# Altium schematic sheet MCU.SchDoc
size A4; SheetNumber: 2; SheetTotal: 5
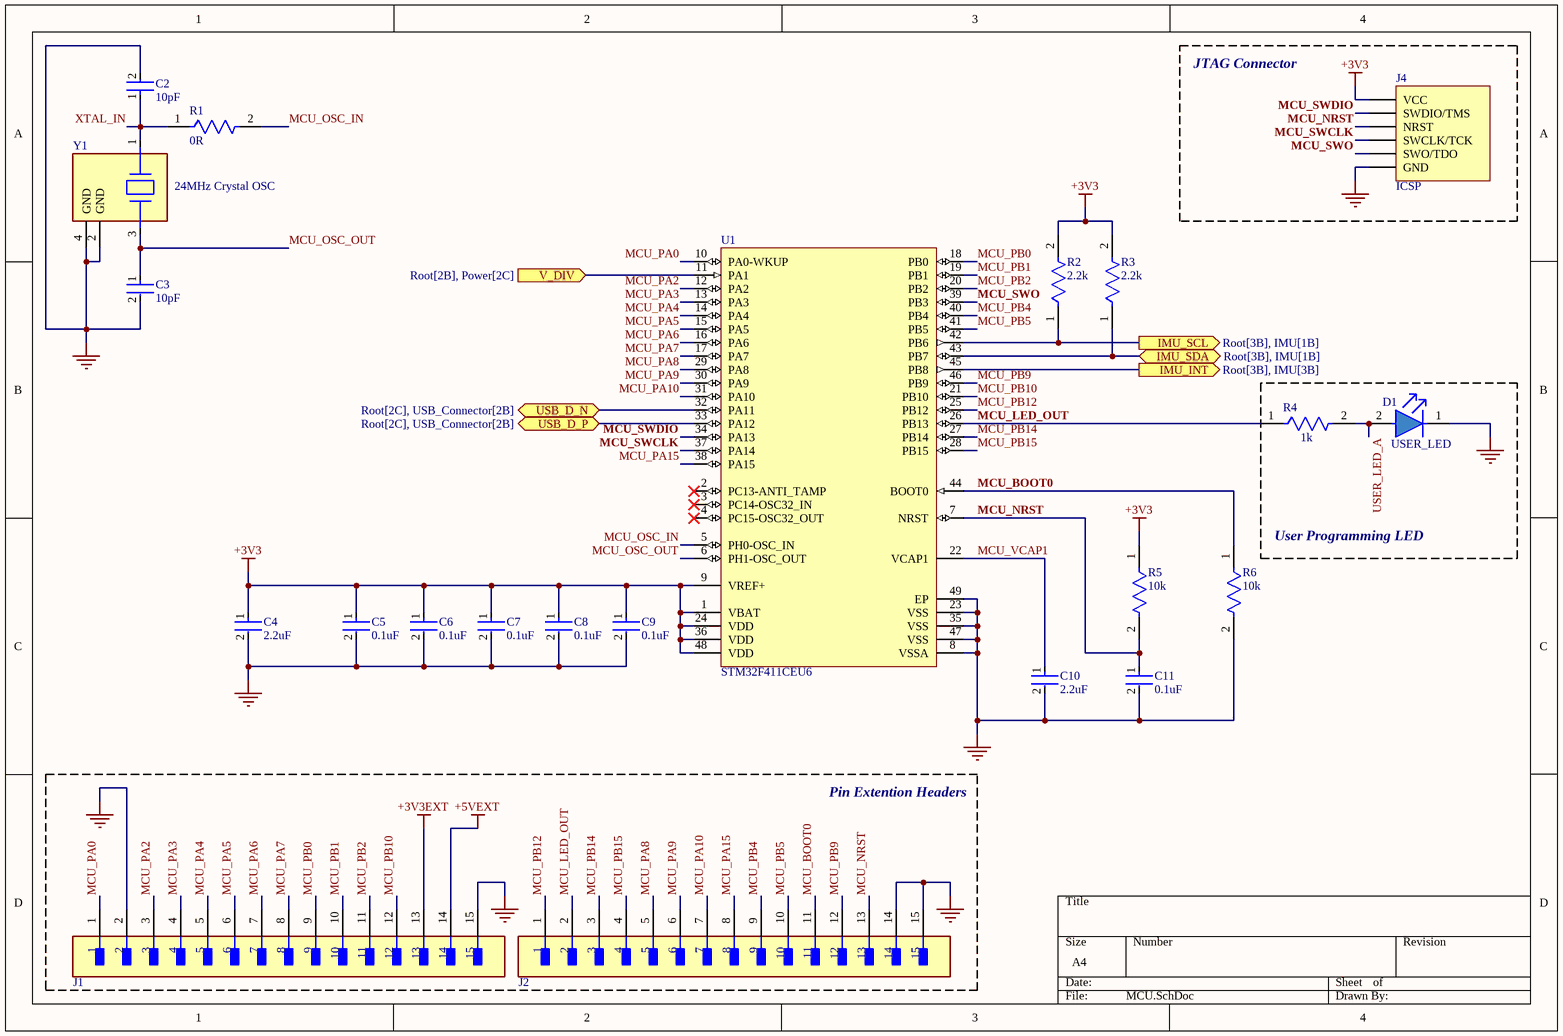
[diagram p0: MCU.SchDoc]

## Parts
C2  10pF  [FP-C0402-BB-MFG]
C3  10pF  [FP-C0402-BB-MFG]
C4  2.2uF  [FP-CC0603-DA-MFG]
C5  0.1uF  [FP-CC0402-MFG]
C6  0.1uF  [FP-CC0402-MFG]
C7  0.1uF  [FP-CC0402-MFG]
C8  0.1uF  [FP-CC0402-MFG]
C9  0.1uF  [FP-CC0402-MFG]
C10  2.2uF  [FP-CC0603-DA-MFG]
C11  0.1uF  [FP-CC0402-MFG]
D1  USER_LED  [FP-LTST-C191TBKT-MFG]
J1  TSW-115-23-T-S  [FP-TSW-115-23-T-S-MFG]  (value not drawn)
J2  TSW-115-23-T-S  [FP-TSW-115-23-T-S-MFG]  (value not drawn)
J4  ICSP  [TC2030-MCP-NL]  (no BOM)
R1  0R  [FP-MCS0402-MFG]
R2  2.2k  [FP-RT0402-MFG]
R3  2.2k  [FP-RT0402-MFG]
R4  1k  [FP-AT0402-MFG]
R5  10k  [FP-RT0402-MFG]
R6  10k  [FP-RT0402-MFG]
U1  STM32F411CEU6  [STM-UFQFPN48_L]
Y1  24MHz Crystal OSC  [FP-ABM10W-MFG]

## Blocks framed on the sheet
JTAG Connector: J4
User Programming LED: D1 R4

## Ports
IMU_INT (out, see Root[3B], IMU[3B]), IMU_SCL (out, see Root[3B], IMU[1B]), IMU_SDA (bidir, see Root[3B], IMU[1B]), USB_D_N (bidir, see Root[2C], USB_Connector[2B]), USB_D_P (bidir, see Root[2C], USB_Connector[2B]), V_DIV (in, see Root[2B], Power[2C])

## Nets
+3V3: C4.1 C5.1 C6.1 C7.1 C8.1 C9.1 J4.1(VCC) R2.2 R3.2 R5.1 U1.1(VBAT) U1.9(VREF+) U1.24(VDD) U1.36(VDD) U1.48(VDD)
+3V3EXT: J1.13
+5VEXT: J1.14
GND: C2.2 C3.2 C4.2 C5.2 C6.2 C7.2 C8.2 C9.2 C10.2 C11.2 D1.1(C) J1.2 J1.15 J2.14 J2.15 J4.5(GND) R6.2 U1.8(VSSA) U1.23(VSS) U1.35(VSS) U1.47(VSS) U1.49(EP) Y1.2(GND) Y1.4(GND)
IMU_INT: U1.45(PB8) ; port IMU_INT
IMU_SCL: R2.1 U1.42(PB6) ; port IMU_SCL
IMU_SDA: R3.1 U1.43(PB7) ; port IMU_SDA
MCU_BOOT0: J2.11 R6.1 U1.44(BOOT0)
MCU_LED_OUT: J2.2 R4.1 U1.26(PB13)
MCU_NRST: C11.1 J2.13 J4.3(NRST) R5.2 U1.7(NRST)
MCU_OSC_IN: R1.2 U1.5(PH0-OSC_IN)
MCU_OSC_OUT: C3.1 U1.6(PH1-OSC_OUT) Y1.3
MCU_PA0: J1.1 U1.10(PA0-WKUP)
MCU_PA2: J1.3 U1.12(PA2)
MCU_PA3: J1.4 U1.13(PA3)
MCU_PA4: J1.5 U1.14(PA4)
MCU_PA5: J1.6 U1.15(PA5)
MCU_PA6: J1.7 U1.16(PA6)
MCU_PA7: J1.8 U1.17(PA7)
MCU_PA8: J2.5 U1.29(PA8)
MCU_PA9: J2.6 U1.30(PA9)
MCU_PA10: J2.7 U1.31(PA10)
MCU_PA15: J2.8 U1.38(PA15)
MCU_PB0: J1.9 U1.18(PB0)
MCU_PB1: J1.10 U1.19(PB1)
MCU_PB2: J1.11 U1.20(PB2)
MCU_PB4: J2.9 U1.40(PB4)
MCU_PB5: J2.10 U1.41(PB5)
MCU_PB9: J2.12 U1.46(PB9)
MCU_PB10: J1.12 U1.21(PB10)
MCU_PB12: J2.1 U1.25(PB12)
MCU_PB14: J2.3 U1.27(PB14)
MCU_PB15: J2.4 U1.28(PB15)
MCU_SWCLK: J4.4(SWCLK/TCK) U1.37(PA14)
MCU_SWDIO: J4.2(SWDIO/TMS) U1.34(PA13)
MCU_SWO: J4.6(SWO/TDO) U1.39(PB3)
MCU_VCAP1: C10.1 U1.22(VCAP1)
USB_D_N: U1.32(PA11) ; port USB_D_N
USB_D_P: U1.33(PA12) ; port USB_D_P
USER_LED_A: D1.2(A) R4.2
V_DIV: U1.11(PA1) ; port V_DIV
XTAL_IN: C2.1 R1.1 Y1.1

Not connected (* = marked no-connect by the designer): U1 2(PC13-ANTI_TAMP)* 3(PC14-OSC32_IN)* 4(PC15-OSC32_OUT)*

## Notes on the sheet
- Pin Extention Headers

## Library data of the parts
C2 C3 = CMP-03020-018108-1: C0402 10 pF X7R 10.00% 16 V; Manufacturer: Kemet; Manufacturer Part Number: C0402C100K4RACAUTO; Tolerance: 0.1; Material: Ceramic; Temperature Coefficient: 15%; Voltage Rating: 16 V; Temperature: -55°C to +125°C; Ipc Land Pattern Name: CAPC10050X50; Temperature Characteristic: X7R; Automotive: No; ComponentLink2Description: Datasheet; Device Class L2: Capacitors; Temperature Range High: +125°C; ComponentLink2URL: https://content.kemet.com/datasheets/KEM_C1002_X7R_SMD.pdf; Device Class L1: Passive Components; Category: Cap; Value: 10 pF; Device Class L3: Ceramic Capacitors; Lead Free: Yes; Octopart: https://octopart.com/c0402c100k4racauto-kemet-91893731; RoHS: TRUE; Package: C0402-BB; Height: 0.55mm; Temperature Range Low: -55°C; Capacitance: 10 pF
C4 C10 = CMP-03422-000148-1: CAP CER 2.2UF 10V X7R 0603; Manufacturer: YAGEO; Manufacturer Part Number: CC0603KRX7R6BB225; Tolerance: 0.1; Temperature Coefficient: 15%; Material: Ceramic; Category: Cap; Temperature Range Low: -55°C; Device Class L1: Passive Components; ComponentLink2URL: http://www.yageo.com/documents/recent/UPY-GPHC_X7R_6.3V-to-50V_18.pdf; Value: 2.2 uF; Octopart: https://octopart.com/cc0603krx7r6bb225-yageo-20649696; Lead Free: Yes; Digikey Description: CAP CER 2.2UF 10V X7R 0603; Device Class L2: Capacitors; Height: 0.9mm; Package: CC0603-DA; Automotive: No; Voltage Rating: 10 V; Temperature Characteristic: X7R; Mouser Description: Multilayer Ceramic Capacitors MLCC - SMD/SMT 2.2uF 10V X7R 10%; Device Class L3: Ceramic Capacitors; Temperature Range High: +125°C; RoHS: TRUE; Temperature: -55°C to +125°C; Footprint Url: http://www.yageo.com/exep/pages/download/literatures/UPY-C_GEN_24.pdf; ComponentLink2Description: Datasheet; Voltage: 10 V; Capacitance: 2.2 uF
C5-C9 C11 = CMP-03422-001121-1: CAP CER 0.1UF 16V X7R 0402; Manufacturer: YAGEO; Manufacturer Part Number: CC0402KPX7R7BB104; Material: Ceramic; Temperature Coefficient: 30ppm/°C; Capacitance: 100 nF; Automotive Grade: NA; Value: 100 nF; Tolerance: 0.1; Digikey Description: CAP CER 0.1UF 16V X7R 0402; Temperature Range Low: -55°C; Footprint Url: http://www.yageo.com/exep/pages/download/literatures/UPY-C_GEN_24.pdf; RoHS: TRUE; Device Class L3: Ceramic Capacitors; Temperature Characteristic: X7R; Package: CC0402; Device Class L1: Passive Components; Lead Free: Yes; Temperature Range High: +125°C; Category: Cap; Mouser Description: 0402 0.1 uF 16 V ±10% Tolerance X7R SMT Multilayer Ceramic Capacitor; Voltage Rating: 16 V; ComponentLink2Description: Datasheet; Automotive: No; Octopart: https://octopart.com/cc0402kpx7r7bb104-yageo-21548559; ComponentLink2URL: http://www.yageo.com/documents/recent/UPY-GP_NP0_16V-to-50V_16.pdf; Height: 0.55mm; Device Class L2: Capacitors; Temperature: -55°C to +125°C; Ipc Land Pattern Name: CAPC10050X50
D1 = CMP-22017-000008-1: LED BLUE CLEAR CHIP SMD; Lens Color: Colorless; Dominant Wavelength: 475nm; Forward Current: 20mA; Wavelength: 468nm; Viewing Angle: 130°; Power Dissipation: 76mW; Luminous Intensity: 180mcd; Reverse Voltage: 5V; Number of Elements: 1; Lens Style: Diffused; Forward Voltage: 3.8V; Max Power Dissipation: 75mW; Case Code (Metric): 1608; Packaging: Tape and Reel; Case/Package: 0603; Depth: 1.6mm; Mount: Surface Mount; Lead Free: Lead Free; Min Operating Temperature: -20°C; Lens Transparency: Clear; Illumination Color: Blue; Height: 0.55mm; Test Current: 20mA; Case Code (Imperial): 0603; Max Operating Temperature: 80°C; Number of Pins: 2; Length: 0.8mm; Radiation Hardening: No; Package Quantity: 1; Number of LEDs: 1; Width: 0.8mm; Color: Blue
J1 J2 = CMP-02766-001466-1: CONN HEADER VERT 15POS 2.54MM; Connector Type: Male Pin; Number of Contacts: 15; Gender: Male; Pitch: 0.1inch; Termination: Solder; Packaging: Bulk; Lead Free: Lead Free; Housing Color: Black; Housing Material: Plastic; Color: Black; RoHS Compliant: Yes; Contact Type: Male Pin; Width: 2.54mm; Mount: Through Hole; Contact Material: Bronze; Number of Rows: 1; Radiation Hardening: No; Number of Positions: 15; Length: 38.1mm; REACH SVHC: No SVHC; Height: 2.54mm; Contact Plating: Tin; Series: TSW; Contact Mating Length: 0.23inch
R1 = CMP-02407-001042-1: RES SMD 1.2K OHM 1% 1/10W 0402; Resistance: 0mR; Voltage Rating: 50V; Max Power Dissipation: 100mW; Composition: Thin Film; Max Operating Temperature: 125°C; Number of Terminations: 2; Mount: Surface Mount; Packaging: Tape and Reel; REACH SVHC: No SVHC; Case Code (Metric): 1005; Package Quantity: 1; Radiation Hardening: No; Termination: Wraparound; Case Code (Imperial): 0402; Contact Plating: Tin; Depth: 0.5mm; Height: 0.015inch; Length: 1mm; Voltage Rating (DC): 50V; Power Rating: 100mW; Lead Free: Lead Free; Min Operating Temperature: -55°C; Military Standard: Not; Width: 0.02inch; Case/Package: 0402
R2 R3 = CMP-03412-019720-1: RES SMD 2.2K OHM 0.1% 1/16W 0402; Manufacturer: Yageo; Manufacturer Part Number: RT0402BRE072K2L; Power Rating: 0.063W; Temperature Coefficient: 50 ppm/°C; Value: 2.2KΩ; Tolerance: 0.001; Voltage Rating: 50V; ComponentLink2URL: http://www.yageo.com/documents/recent/PYu-RT_1-to-0.01_RoHS_L_9.pdf; RoHS: TRUE; Device Class L3: Chip SMD Resistors; Category: Res; Ipc Land Pattern Name: RESC10050X30; Series: RT; Lead Free: Yes; Device Class L1: Passive Components; Temperature Range Low: -55°C; Package: RT0402; Automotive: No; Octopart: https://octopart.com/rt0402bre072k2l-yageo-1445889; Temperature: -55°C to +155°C; Footprint Url: http://www.yageo.com/exep/pages/download/literatures/PYu-R_Mount_10.pdf; Composition: Thin Film; Resistance: 2.2KΩ; Temperature Range High: +155°C; Digikey Description: RES SMD 2.2K OHM 0.1% 1/16W 0402; Device Class L2: Resistors; ComponentLink2Description: Datasheet; Height: 0.35mm
R4 = CMP-03412-049230-1: Thin Film Chip Resistors Automotive Grade 1kΩ 1% 25ppm/°C 0402
R5 R6 = CMP-2002-02973-2: RES SMD 10K OHM 0.1% 1/16W 0402; Manufacturer Part Number: RT0402BRE0710KL; Manufacturer: Yageo; Power Rating: 0.063W; Resistance: 10KΩ; Temperature Coefficient: 50 ppm/°C; Tolerance: 0.001; Voltage Rating: 50V; Value: 10KΩ; Octopart: https://octopart.com/rt0402bre0710kl-yageo-1416557; Digikey Description: RES SMD 10K OHM 0.1% 1/16W 0402; Category: Res; Temperature Range Low: -55°C; Ipc Land Pattern Name: RESC10050X30; Automotive: No; Package: RT0402; Temperature: -55°C to +155°C; Series: RT; Lead Free: Yes; Device Class L3: Chip SMD Resistors; ComponentLink2URL: http://www.yageo.com/documents/recent/PYu-RT_1-to-0.01_RoHS_L_9.pdf; Height: 0.35mm; ComponentLink2Description: Datasheet; RoHS: TRUE; Composition: Thin Film; Device Class L2: Resistors; Device Class L1: Passive Components; Temperature Range High: +155°C; Footprint Url: http://www.yageo.com/exep/pages/download/literatures/PYu-R_Mount_10.pdf; Mouser Description: Res Thin Film 0402 10K Ohm 0.1% 1/16W ±50ppm/°C Molded SMD Paper T/R
U1 = CMP-0243-00165-1: ARM Cortex-M4 32-bit MCU+FPU, 512 KB Flash, 128 KB RAM, 36 I/Os, 48-Pin UFQFPN, -40 to 85 degC, Tray; Operating Frequency(F) (Processor speed) (MHz): 100; FLASH Size (Prog) (kB): 512; Internal RAM Size (kB): 128; I/Os (High Current): 36; Supply Voltage(Vcc) min (V): 1.7; Package Reference: 48-Pin Ultra Thin Fine Pitch Quad Flat No-Lead, 7 x 7 x 0.6 mm Body, 0.5 mm Pitch, Exposed Pad; ComponentLink1Description: Manufacturer URL; ComponentLink1URL: http://www.st.com/; Packing: Tray; Package Description: UFQFPN48; Core: ARM Cortex-M4; ComponentLink2Description: Datasheet; ComponentLink2URL: http://www.st.com/st-web-ui/static/active/en/resource/technical/document/datasheet/DM00115249.pdf; DatasheetVersion: Rev. 6; Mounting Technology: Surface Mount
Y1 = CMP-27762-001102-1: Crystal 24MHz ±20ppm 8pF SMD-4 2.5mm x 2mm